# Altium project Powermodule-v11.0.0.PrjPcb (part 3 of 5)

## Sheet Connector_Section.SchDoc
size 420 x 297 mm; SheetNumber: 6; SheetTotal: 8
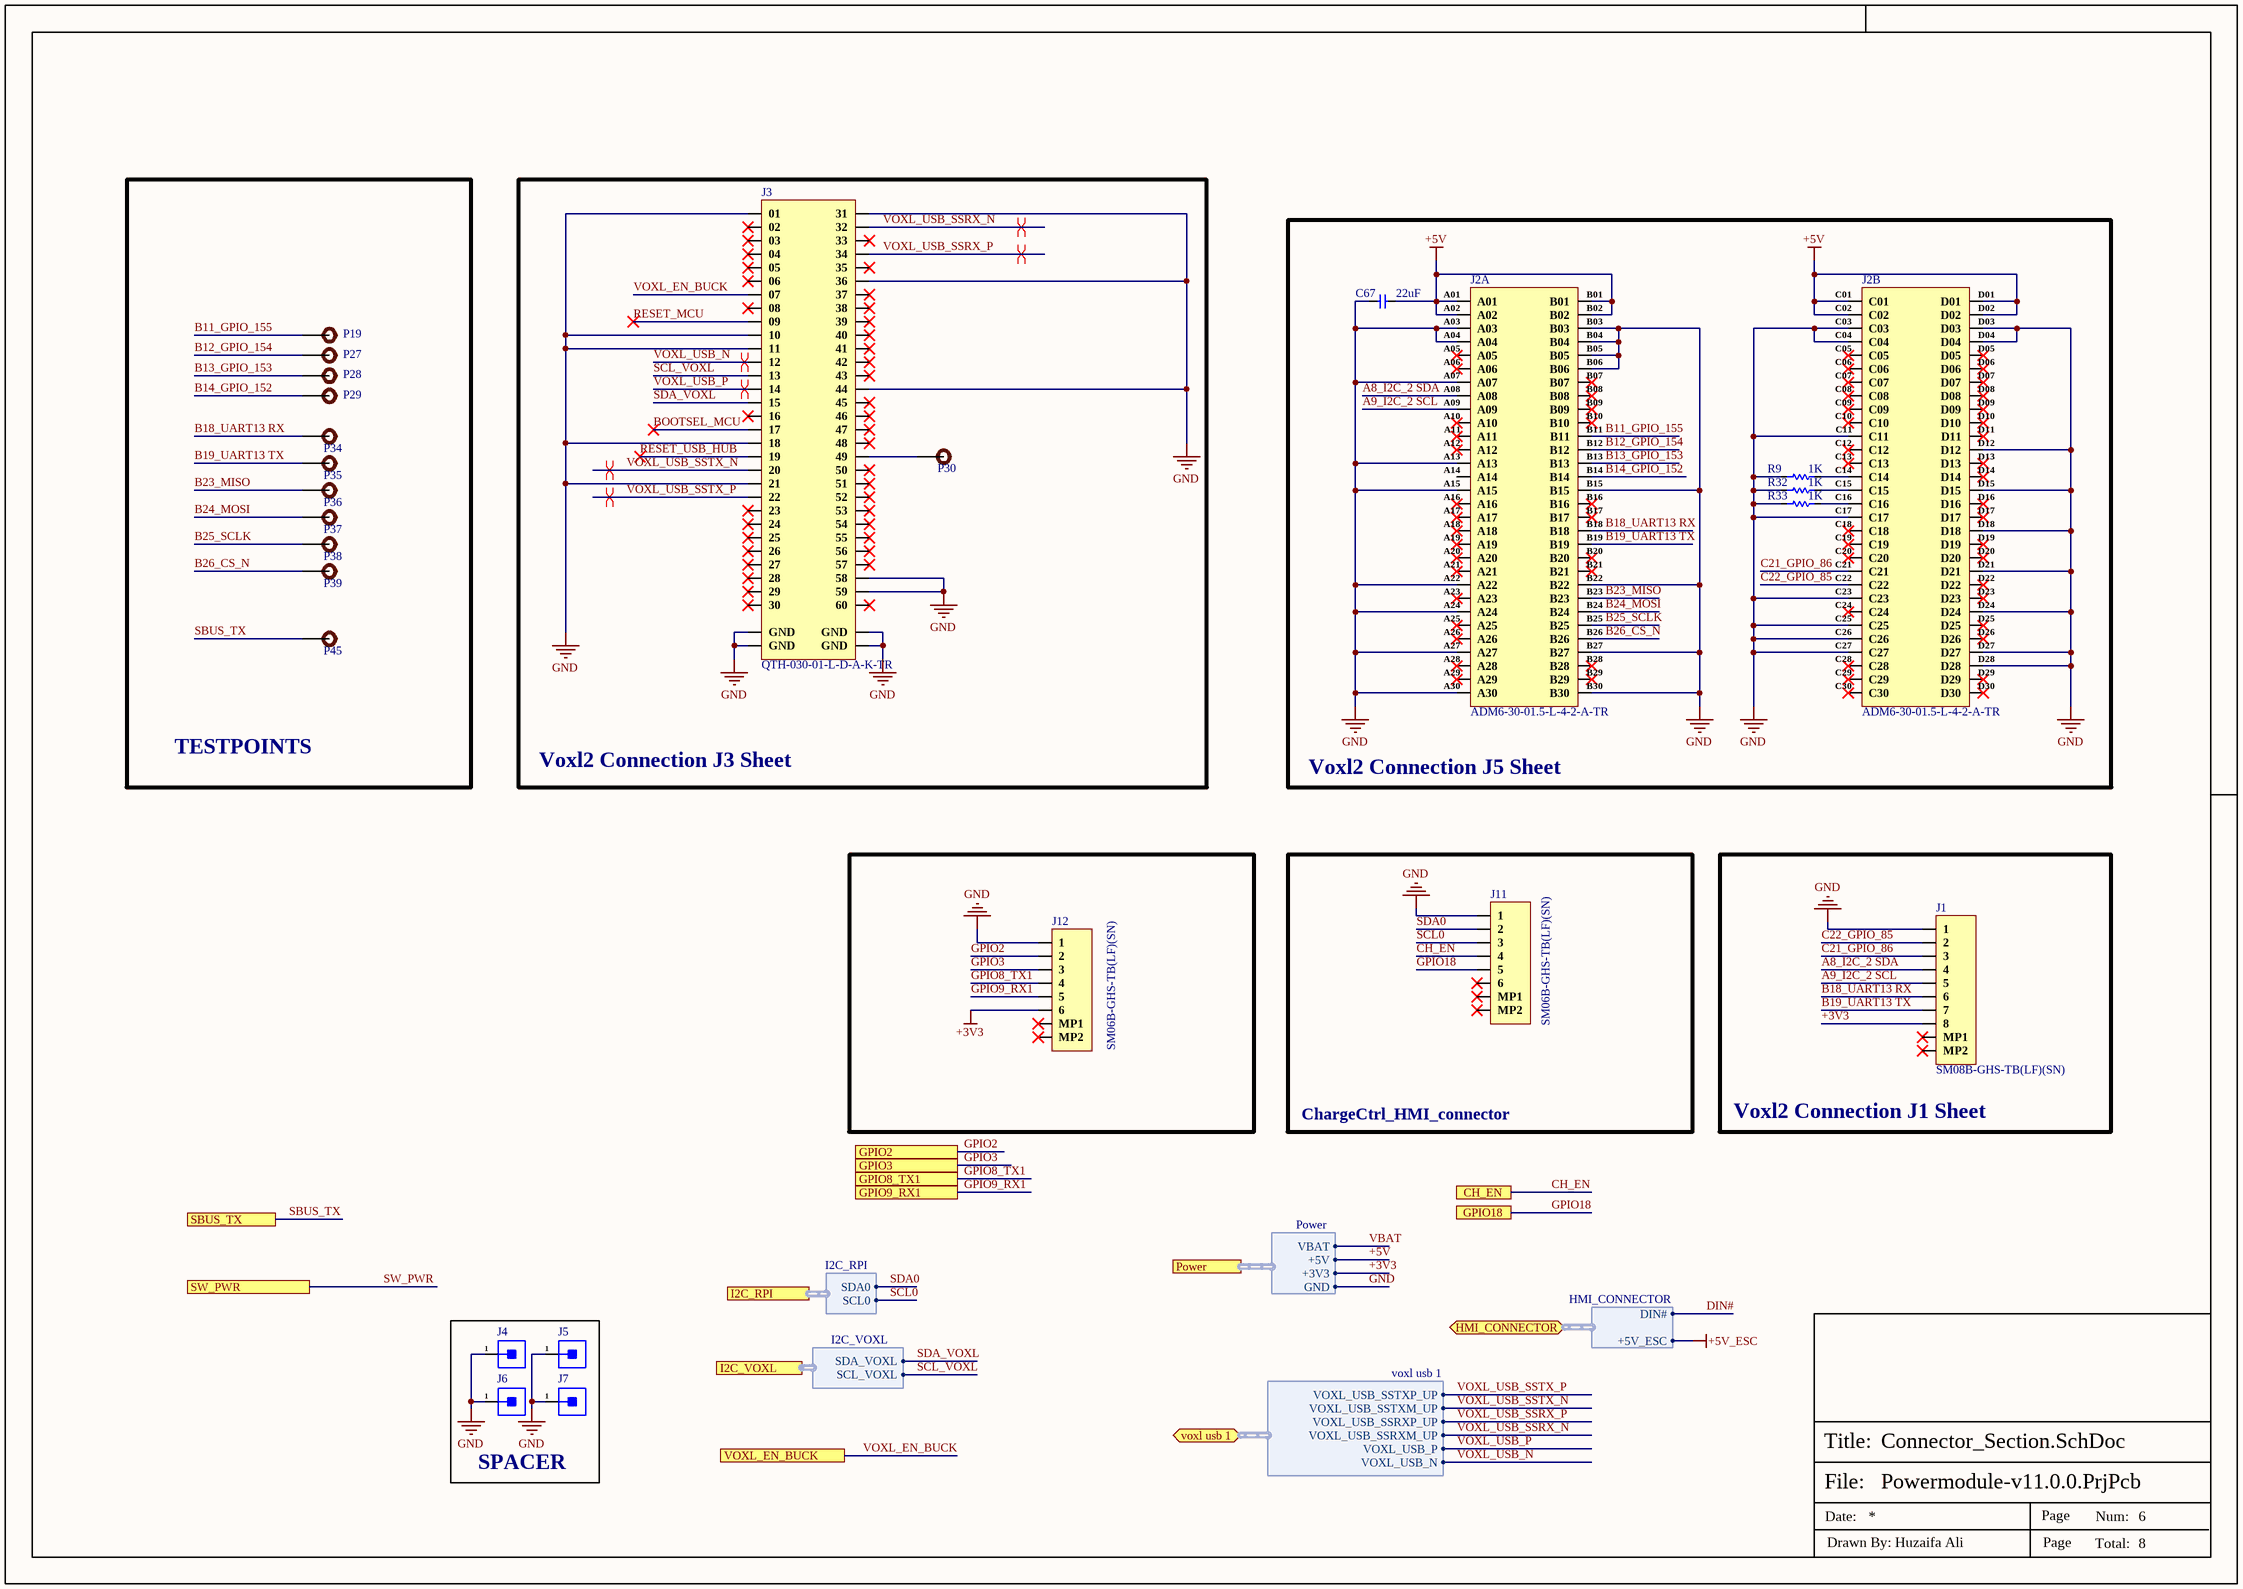
[diagram p4: Connector_Section.SchDoc]

### Parts
C67  22uF  [Cap-0402]
J1  SM08B-GHS-TB(LF)(SN)  [SM08B-GHS-TB(LF)(SN)]
J2  ADM6-30-01.5-L-4-2-A-TR  [ADM6-30-01.5-L-4-2-A-TR]  (parts A,B of 2)
J3  QTH-030-01-L-D-A-K-TR  [QTH-030-01-L-D-A-K-TR]
J4  9774050151R  [Spacer]  (value not drawn)
J5  9774050151R  [Spacer]  (value not drawn)
J6  9774050151R  [Spacer]  (value not drawn)
J7  9774050151R  [Spacer]  (value not drawn)
J11  SM06B-GHS-TB(LF)(SN)  [SM06B-GHS-TB(LF)(SN)]
J12  SM06B-GHS-TB(LF)(SN)  [SM06B-GHS-TB(LF)(SN)]
P19  TEST POINT  [Test-point]  (value not drawn)
P27  TEST POINT  [Test-point]  (value not drawn)
P28  TEST POINT  [Test-point]  (value not drawn)
P29  TEST POINT  [Test-point]  (value not drawn)
P30  TEST POINT  [Test-point]  (value not drawn)
P34  TEST POINT  [Test-point]  (value not drawn)
P35  TEST POINT  [Test-point]  (value not drawn)
P36  TEST POINT  [Test-point]  (value not drawn)
P37  TEST POINT  [Test-point]  (value not drawn)
P38  TEST POINT  [Test-point]  (value not drawn)
P39  TEST POINT  [Test-point]  (value not drawn)
P45  TEST POINT  [Test-point]  (value not drawn)
R9  1K  [Res-0402]
R32  1K  [Res-0402]
R33  1K  [Res-0402]

### Blocks framed on the sheet
TESTPOINTS: P19 P27-P29 P34-P39 P45
Voxl2 Connection J3 Sheet: J3 P30
Voxl2 Connection J5 Sheet: C67 J2 R9 R32 R33
ChargeCtrl_HMI_connector: J11
Voxl2 Connection J1 Sheet: J1
SPACER: J4-J7

### Ports
CH_EN (see Top-Sheet[2A], Power_Section[2D]), GPIO2 (see Top-Sheet[2B], Controller_Section[1C]), GPIO3 (see Top-Sheet[2B], Controller_Section[1C]), GPIO8_TX1 (see Top-Sheet[2B], Controller_Section[1C]), GPIO9_RX1 (see Top-Sheet[2B], Controller_Section[1C]), GPIO18 (see Top-Sheet[2B], Controller_Section[1D], Power_Section[2D]), HMI_CONNECTOR (bidir, harness HMI_CONNECTOR, see Top-Sheet[1B], Power_Section[4D]), I2C_RPI (harness I2C_RPI, see Top-Sheet[1B], Controller_Section[3D]), I2C_VOXL (harness I2C_VOXL, see Top-Sheet[2A], Controller_Section[2D], RTC_Section[2D]), Power (harness Power, see Top-Sheet[1A], Controller_Section[2D], FlashMemory_Section[1D], Power_Section[3D], RTC_Section[2D], USB HUB_Section[1D], WiFiModule_Section[2D]), SBUS_TX (see Top-Sheet[1B], Controller_Section[1C]), SW_PWR (see Top-Sheet[1A], Power_Section[2D]), voxl usb 1 (bidir, harness voxl usb 1, see Top-Sheet[1A], USB HUB_Section[4D]), VOXL_EN_BUCK (see Top-Sheet[1A], Power_Section[2D])

### Harnesses
Power: +5V, +3V3, GND, VBAT
I2C_VOXL: SCL_VOXL, SDA_VOXL
voxl usb 1: VOXL_USB_SSTXP_UP, VOXL_USB_SSTXM_UP, VOXL_USB_SSRXP_UP, VOXL_USB_SSRXM_UP, VOXL_USB_P, VOXL_USB_N
I2C_RPI: SDA0, SCL0
HMI_CONNECTOR: DIN#, +5V_ESC

### Nets
+3V3: J1.8 J12.6 ; port Power.+3V3
+5V: C67.1 J2.A01 J2.A02 J2.B01 J2.B02 J2.C01 J2.C02 J2.D01 J2.D02 ; port Power.+5V
GND: C67.2 J1.1 J2.A03 J2.A04 J2.A07 J2.A13 J2.A15 J2.A22 J2.A24 J2.A27 J2.A30 J2.B03 J2.B04 J2.B05 J2.B06 J2.B15 J2.B22 J2.B27 J2.B30 J2.C03 J2.C04 J2.C11 J2.C17 J2.C23 J2.C25 J2.C26 J2.C27 J2.D03 J2.D04 J2.D12 J2.D15 J2.D18 J2.D21 J2.D24 J2.D27 J2.D28 J3.01 J3.10 J3.11 J3.18 J3.21 J3.31 J3.36 J3.44 J3.58 J3.59 J3.G1(GND) J3.G2(GND) J3.G3(GND) J3.G4(GND) J4.1 J5.1 J6.1 J7.1 J11.1 J12.1 R9.1 R32.1 R33.1 ; port Power.GND
VOXL_EN_BUCK: J3.07 ; port VOXL_EN_BUCK
A8_I2C_2 SDA: J1.4 J2.A08
A9_I2C_2 SCL: J1.5 J2.A09
B11_GPIO_155: J2.B11 P19.1
B12_GPIO_154: J2.B12 P27.1
B13_GPIO_153: J2.B13 P28.1
B14_GPIO_152: J2.B14 P29.1
B18_UART13 RX: J1.6 J2.B18 P34.1
B19_UART13 TX: J1.7 J2.B19 P35.1
B23_MISO: J2.B23 P36.1
B24_MOSI: J2.B24 P37.1
B25_SCLK: J2.B25 P38.1
B26_CS_N: J2.B26 P39.1
BOOTSEL_MCU: J3.17
C21_GPIO_86: J1.3 J2.C21
C22_GPIO_85: J1.2 J2.C22
CH_EN: J11.4 ; port CH_EN
GPIO2: J12.2 ; port GPIO2
GPIO3: J12.3 ; port GPIO3
GPIO8_TX1: J12.4 ; port GPIO8_TX1
GPIO9_RX1: J12.5 ; port GPIO9_RX1
GPIO18: J11.5 ; port GPIO18
RESET_MCU: J3.09
RESET_USB_HUB: J3.19
SBUS_TX: P45.1 ; port SBUS_TX
SCL0: J11.3 ; port I2C_RPI.SCL0
SCL_VOXL: J3.13 ; port I2C_VOXL.SCL_VOXL
SDA0: J11.2 ; port I2C_RPI.SDA0
SDA_VOXL: J3.15 ; port I2C_VOXL.SDA_VOXL
VBAT: port Power.VBAT
VOXL_USB_N: J3.12 ; port voxl usb 1.VOXL_USB_N
VOXL_USB_P: J3.14 ; port voxl usb 1.VOXL_USB_P
VOXL_USB_SSRX_N: J3.32 ; port voxl usb 1.VOXL_USB_SSRXM_UP
VOXL_USB_SSRX_P: J3.34 ; port voxl usb 1.VOXL_USB_SSRXP_UP
VOXL_USB_SSTX_N: J3.20 ; port voxl usb 1.VOXL_USB_SSTXM_UP
VOXL_USB_SSTX_P: J3.22 ; port voxl usb 1.VOXL_USB_SSTXP_UP
NetJ2_C14: J2.C14 R9.2
NetJ2_C15: J2.C15 R32.2
NetJ2_C16: J2.C16 R33.2
NetJ3_49: J3.49 P30.1

Not connected (* = marked no-connect by the designer): J1 MP1* MP2*; J2 A05* A06* A10* A11* A12* A14 A16* A17* A18* A19* A20* A21* A23* A25* A26* A28* A29* B07* B08* B09* B10* B16* B17* B20* B21* B28* B29* C05* C06* C07* C08* C09* C10* C12* C13* C18* C19* C20* C24* C28* C29* C30* D05* D06* D07* D08* D09* D10* D11* D13* D14* D16* D17* D19* D20* D22* D23* D25* D26* D29* D30*; J3 02* 03* 04* 05* 06* 08* 16* 23* 24* 25* 26* 27* 28* 29* 30* 33* 35* 37* 38* 39* 40* 41* 42* 43* 45* 46* 47* 48* 50* 51* 52* 53* 54* 55* 56* 57* 60*; J11 6* MP1* MP2*; J12 MP1* MP2*

### Layout directives
differential pair; net class VOXL_USB; differential pair class VOXL_USB_Lines; rule Matched Net Lengths [Tolerance = 0.508mm]; rule Impedance Constraint [Min = 88.00    Max = 102.0    ]: VOXL_USB_N, VOXL_USB_P
differential pair; net class VOXL_SS_USB; differential pair class VOXL_SS_USB_Lines; rule Matched Net Lengths [Tolerance = 0.508mm]; rule Impedance Constraint [Min = 88.00    Max = 102.0    ]: VOXL_USB_SSRX_N, VOXL_USB_SSRX_P, VOXL_USB_SSTX_N, VOXL_USB_SSTX_P

### Notes on the sheet
- File:
- Title:
- Date:
- Page
- Num:
- Total:
- Drawn By: Huzaifa Ali

### Library data of the parts
C67 = GRM158R61A226ME15D: CAP CER 22UF 10V X5R 0402; Manufacturer: Murata; Material: 4241ConductorMaterial; Dielectric: 1537DielectricType; Tolerance: 20%; Item Type: Capacitor; Supplier: Mouser; Supplier Part Number: 81-GRM158R61A226ME5D; Manufacturer Part Number: GRM158R61A226ME15D; RoHS: Yes; Stock: 328944; Pricing: 1=0.46, 10=0.225, 50=0.225, 100=0.146, 1000=0.124, 10000=0.106 (USD); Case/Package: 343Case; Min Operating Temperature: -55°C; Max Operating Temperature: 85°C; Value: 22uF; Voltage Rating: 10V; Voltage Rating (DC): 10V; Length: 1mm; Width: 500um; Height: 800um; Thickness: 800um; LCSC Part Number: C3845593; Category: Ceramic Capacitors
J1 = SM08B-GHS-TB(LF)(SN): CONN HEADER SMD R/A 8POS 1.25MM; Manufacturer: JST; Item Type: Connectors; Number of Positions: 8; Current Rating: 1A; Voltage Rating: 50V; Supplier: Arrow Electronics; LCSC Part Number: C265111; Manufacturer Part Number: SM08B-GHS-TB(LF)(SN); RoHS: Yes; Stock: 5000; Pricing: 2500=0.3128, 5000=0.3063 (USD); Mounting Technology: Surface Mount; Contact Material: Bronze; Contact Shape: Rectangular; Contact Finish - Mating: TIN; Insulation Material: Nylon; Insulation Color: Natural; Housing Color: 50Colour; Housing Material: 4261ConductorMaterial; Packaging: Cut Tape; Number of Rows: 1; Termination: Solder; Fastening Type: Ramp; Connector Type: Header; Series: GH; Contact Type: Outer Shroud Contact; Number of Contacts: 8; Orientation: Right Angle; Pitch: 1.25mm; Flammability Rating: UL94 V-0; Lead Free: 5697LeadFree; ComponentLink1URL: https://datasheet.ciiva.com/25617/0900766b810cef18-25617249.pdf?src-supplier=Rs; ComponentLink1Description: https://datasheet.ciiva.com/25617/0900766b810cef18-25617249.pdf?src-supplier=Rs; ComponentLink2URL: https://datasheet.ciiva.com/16290/jst20sm08b-ghs-tb-lf-sn-16290511.pdf?src-supplier=Future+Electronics; ComponentLink2Description: https://datasheet.ciiva.com/16290/jst20sm08b-ghs-tb-lf-sn-16290511.pdf?src-supplier=Future+Electronics
J2 = ADM6-30-01.5-L-4-2-A-TR: CONN 0.635MM HDR 30POS SMD; Manufacturer: Samtec; Item Type: Connector; Supplier: Rs; Supplier Part Number: 2502799; Manufacturer Part Number: ADM6-30-01.5-L-4-2-A-TR; RoHS: No; Category: Connectors; Stock: 10; Pricing: 1=20.84 (GBP); ComponentLink1URL: http://suddendocs.samtec.com/catalog_english/adm6.pdf?src-supplier=Digi-Key; ComponentLink1Description: http://suddendocs.samtec.com/catalog_english/adm6.pdf?src-supplier=Digi-Key; ComponentLink2URL: https://datasheet.octopart.com/ADM6-30-01.5-L-4-2-A-TR-Samtec-datasheet-156965346.pdf?src-supplier=Sager+Electronics; ComponentLink2Description: https://datasheet.octopart.com/ADM6-30-01.5-L-4-2-A-TR-Samtec-datasheet-156965346.pdf?src-supplier=Sager+Electronics; ComponentLink3URL: https://datasheet.octopart.com/ADM6-30-01.5-L-4-2-A-TR-Samtec-datasheet-154586211.pdf?src-supplier=Toby+Electronics; ComponentLink3Description: https://datasheet.octopart.com/ADM6-30-01.5-L-4-2-A-TR-Samtec-datasheet-154586211.pdf?src-supplier=Toby+Electronics; ComponentLink4URL: https://datasheet.octopart.com/ADM6-30-01.5-L-4-2-A-TR-Samtec-datasheet-142027009.pdf?src-supplier=Master+Electronics; ComponentLink4Description: https://datasheet.octopart.com/ADM6-30-01.5-L-4-2-A-TR-Samtec-datasheet-142027009.pdf?src-supplier=Master+Electronics
J3 = QTH-030-01-L-D-A-K-TR: CONN HDR 60POS SMD GOLD; Manufacturer: Samtec; Supplier: Rs; Supplier Part Number: 1802786; Manufacturer Part Number: QTH-030-01-L-D-A-K-TR; RoHS: Yes; Category: Connectors; Stock: 69; Pricing: 1=9.4, 25=8.99, 100=7.57, 250=6.25, 500=6.09 (GBP); ComponentLink1URL: https://datasheet.ciiva.com/9698/qth-9698170.pdf?src-supplier=Avnet; ComponentLink1Description: https://datasheet.ciiva.com/9698/qth-9698170.pdf?src-supplier=Avnet; ComponentLink2URL: https://datasheet.ciiva.com/400/qth-xxx-xx-x-d-xxx-mkt-400842.pdf?src-supplier=Digikey; ComponentLink2Description: https://datasheet.ciiva.com/400/qth-xxx-xx-x-d-xxx-mkt-400842.pdf?src-supplier=Digikey
J4-J7 = 9774050151R: Spacer Material: Steel Mounting: SMT Series: WA-SMSI Thread D: M2.5; Manufacturer: Wurth Electronics; Plating: Tin; Threaded/Unthreaded: Threaded; Outside Diameter: 0.201inch; Supplier: Digikey; Supplier Part Number: 732-7095-1-ND; Manufacturer Part Number: 9774050151R; RoHS: Yes; Category: Spacers, Standoffs; Stock: 39400; Pricing: 1=1.16, 10=1.098, 50=0.979, 100=0.895 (USD); Material: Steel; Min Operating Temperature: -55°C; Max Operating Temperature: 150°C; Series: WA-SMSI; Packaging: 10Packaging; Length: 0.252inch; Height: 5.1mm; Reach SVHC Compliant: Unknown; ComponentLink1URL: http://www.farnell.com/datasheets/1960373.pdf?src-supplier=Farnell; ComponentLink1Description: http://www.farnell.com/datasheets/1960373.pdf?src-supplier=Farnell; ComponentLink2URL: http://www.mouser.com/ds/2/445/9774050151R-611428.pdf?src-supplier=Mouser; ComponentLink2Description: http://www.mouser.com/ds/2/445/9774050151R-611428.pdf?src-supplier=Mouser; ComponentLink3URL: https://media.digikey.com/pdf/Data%20Sheets/Wurth%20Electronics%20PDFs/WA-SMSx_Performance_Flyer.pdf?src-supplier=Digikey; ComponentLink3Description: https://media.digikey.com/pdf/Data%20Sheets/Wurth%20Electronics%20PDFs/WA-SMSx_Performance_Flyer.pdf?src-supplier=Digikey; ComponentLink4URL: http://www.farnell.com/datasheets/1960373.pdf?src-supplier=Element14; ComponentLink4Description: http://www.farnell.com/datasheets/1960373.pdf?src-supplier=Element14; ComponentLink5URL: https://datasheet.octopart.com/9774050151R-W%C3%BCrth-Elektronik-datasheet-48588545.pdf?src-supplier=Element14; ComponentLink5Description: https://datasheet.octopart.com/9774050151R-W%C3%BCrth-Elektronik-datasheet-48588545.pdf?src-supplier=Element14; ComponentLink6URL: http://www.farnell.com/datasheets/1960373.pdf?src-supplier=Newark; ComponentLink6Description: http://www.farnell.com/datasheets/1960373.pdf?src-supplier=Newark; ComponentLink7URL: https://katalog.we-online.de/em/datasheet/9774050151R.pdf?src-supplier=Digikey; ComponentLink7Description: https://katalog.we-online.de/em/datasheet/9774050151R.pdf?src-supplier=Digikey; Item Type: Spacer
J11 J12 = SM06B-GHS-TB(LF)(SN): CONN HEADER SMD R/A 6POS 1.25MM; Manufacturer: JST; Number of Positions: 6; Current Rating: 1A; Voltage Rating: 50V; Supplier: Future Electronics; LCSC Part Number: C133065; Manufacturer Part Number: SM06B-GHS-TB(LF)(SN); RoHS: Yes; Item Type: Headers; Pricing: 2500=0.25, 5000=0.245, 7500=0.24, 10000=0.235 (USD); Mounting Technology: Surface Mount; Contact Material: Bronze; Contact Shape: Rectangular; Contact Finish - Mating: TIN; Insulation Material: Nylon; Insulation Color: Natural; Min Operating Temperature: -25°C; Max Operating Temperature: 85°C; Number of Rows: 1; Packaging: Cut Tape; Termination: Solder; Fastening Type: Ramp; Connector Type: Header; Number of Contacts: 6; Orientation: Right Angle; Series: GH; Contact Type: Outer Shroud Contact; Pitch: 1.25mm; Lead Free: Lead Free; Flammability Rating: UL94 V-0; ComponentLink1URL: https://datasheet.ciiva.com/25617/0900766b810cef18-25617251.pdf?src-supplier=Rs; ComponentLink1Description: https://datasheet.ciiva.com/25617/0900766b810cef18-25617251.pdf?src-supplier=Rs; ComponentLink2URL: https://datasheet.ciiva.com/16487/jstsm06b-ghs-tb-lf-sn-16487196.pdf?src-supplier=Future+Electronics; ComponentLink2Description: https://datasheet.ciiva.com/16487/jstsm06b-ghs-tb-lf-sn-16487196.pdf?src-supplier=Future+Electronics
P19 P27-P30 P34-P39 P45 = TEST POINT: Test Point ON; Item Type: TEST POINT; Manufacturer Part Number: TEST POINT
R9 R32 R33 = CRCW04021K00FKEDHP: RES SMD 1K OHM 1% 1/5W 0402; Manufacturer: Vishay Dale; Resistance: 1kR; Temperature Coefficient: 100ppm/°C; Power Rating: 125mW; Voltage Rating: 50V; Supplier 1: Digi-Key; Manufacturer Part Number: CRCW04021K00FKEDHP; Stock 1: 315989; Pricing 1: 1=0.15, 10=0.132, 100=0.0506, 1000=0.02226, 2500=0.01923, 5000=0.0172 (USD); Mount: Surface Mount; Case/Package: 0402; Number of Pins: 2; Contact Plating: Tin; Weight: 2.3E-05oz; Case Code (Imperial): 0402; Case Code (Metric): 1005; Size Code: 0402; Min Operating Temperature: -55°C; Max Operating Temperature: 155°C; Tolerance: 1%; Resistor Type: Thick Film; Package Quantity: 10; Packaging: Tape and Reel; Number of Terminations: 2; Termination: SMD/SMT; Max Power Dissipation: 125mW; Voltage Rating (DC): 50V; Features: Automotive AEC-Q200; Series: CRCW-HP; Construction: Rectangular; Technology: THICK FILM; Resistance Tolerance: 1%; Length: 1mm; Width: 0.5mm; Height: 0.3mm; Depth: 0.5mm; Radiation Hardening: No; REACH SVHC: Unknown; Military Standard: Not; Lead Free: Lead Free; RoHS Compliant: Yes; ComponentLink1URL: http://www.farnell.com/datasheets/2339608.pdf?src-supplier=Element14; ComponentLink1Description: http://www.farnell.com/datasheets/2339608.pdf?src-supplier=Element14; ComponentLink2URL: http://www.vishay.com/docs/20043/crcwhpe3.pdf?src-supplier=Digi-Key; ComponentLink2Description: http://www.vishay.com/docs/20043/crcwhpe3.pdf?src-supplier=Digi-Key; ComponentLink3URL: http://www.mouser.com/ds/2/427/crcwhpe3-46056.pdf?src-supplier=Mouser; ComponentLink3Description: http://www.mouser.com/ds/2/427/crcwhpe3-46056.pdf?src-supplier=Mouser; ComponentLink4URL: http://www.vishay.com/docs/20043/crcwhpe3.pdf?src-supplier=Avnet; ComponentLink4Description: http://www.vishay.com/docs/20043/crcwhpe3.pdf?src-supplier=Avnet; ComponentLink5URL: http://www.vishay.com/docs/20043/crcwhpe3.pdf?src-supplier=Future+Electronics; ComponentLink5Description: http://www.vishay.com/docs/20043/crcwhpe3.pdf?src-supplier=Future+Electronics; Supplier Part Number 1: 541-1.00KYCT-ND; LCSC Part Number: C313354